# Altium schematic sheet Power_Low_Curr.SchDoc
size A3; Organization: Altium Limited; Address1: L3, 12a Rodborough Rd; Address2: Frenchs Forest; Address3: NSW; Address4: Australia 2086
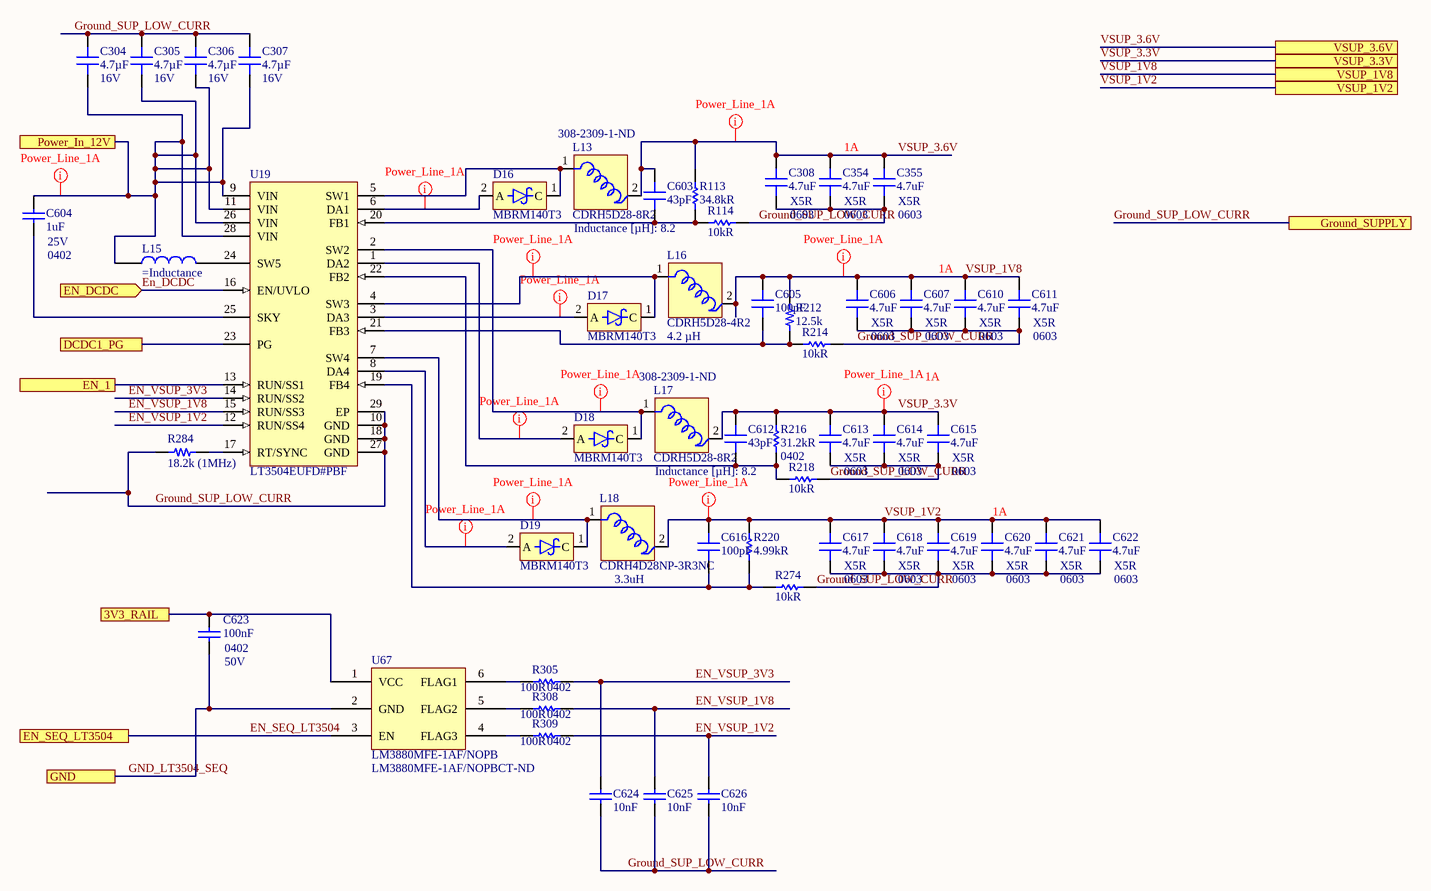
[diagram p0: Power_Low_Curr.SchDoc]

## Parts
C304  4.7µF  Parameter 1: 16V  [CAP 0603/1608 RF]
C305  4.7µF  Parameter 1: 16V  [CAP 0603/1608 RF]
C306  4.7µF  Parameter 1: 16V  [CAP 0603/1608 RF]
C307  4.7µF  Parameter 1: 16V  [CAP 0603/1608 RF]
C308  4.7uF  Case/Package: 0603  Dielectric: X5R  [CAP 0603/1608 RF]
C354  4.7uF  Case/Package: 0603  Dielectric: X5R  [CAP 0603/1608 RF]
C355  4.7uF  Case/Package: 0603  Dielectric: X5R  [CAP 0603/1608 RF]
C603  43pF  [CAP 0201/0603 KK]
C604  1uF  Case/Package: 0402  Voltage Rating: 25V  [CAP 0402/1005 KK]
C605  100pF  [CAP 0201/0603 KK]
C606  4.7uF  Case/Package: 0603  Dielectric: X5R  [CAP 0603/1608 RF]
C607  4.7uF  Case/Package: 0603  Dielectric: X5R  [CAP 0603/1608 RF]
C610  4.7uF  Case/Package: 0603  Dielectric: X5R  [CAP 0603/1608 RF]
C611  4.7uF  Case/Package: 0603  Dielectric: X5R  [CAP 0603/1608 RF]
C612  43pF  [CAP 0201/0603 KK]
C613  4.7uF  Case/Package: 0603  Dielectric: X5R  [CAP 0603/1608 RF]
C614  4.7uF  Case/Package: 0603  Dielectric: X5R  [CAP 0603/1608 RF]
C615  4.7uF  Case/Package: 0603  Dielectric: X5R  [CAP 0603/1608 RF]
C616  100pF  [CAP 0201/0603 KK]
C617  4.7uF  Case/Package: 0603  Dielectric: X5R  [CAP 0603/1608 RF]
C618  4.7uF  Case/Package: 0603  Dielectric: X5R  [CAP 0603/1608 RF]
C619  4.7uF  Case/Package: 0603  Dielectric: X5R  [CAP 0603/1608 RF]
C620  4.7uF  Case/Package: 0603  Dielectric: X5R  [CAP 0603/1608 RF]
C621  4.7uF  Case/Package: 0603  Dielectric: X5R  [CAP 0603/1608 RF]
C622  4.7uF  Case/Package: 0603  Dielectric: X5R  [CAP 0603/1608 RF]
C623  100nF  Case Code (Imperial): 0402  Voltage: 50V  [CAP 0402/1005 KK]
C624  10nF  [CAP 0201/0603 KK]
C625  10nF  [CAP 0201/0603 KK]
C626  10nF  [CAP 0201/0603 KK]
D16  MBRM140T3  [CASE 457]
D17  MBRM140T3  [CASE 457]
D18  MBRM140T3  [CASE 457]
D19  MBRM140T3  [CASE 457]
L13  CDRH5D28-8R2  Inductance [µH]: 8.2  Supplier Part Number 1: 308-2309-1-ND  [CDRH5D28]
L15  (no value)  [FB0603]
L16  CDRH5D28-4R2  Inductance: 4.2 µH  [CDRH5D28]
L17  CDRH5D28-8R2  Inductance [µH]: 8.2  Supplier Part Number 1: 308-2309-1-ND  [CDRH5D28]
L18  CDRH4D28NP-3R3NC  Inductance: 3.3uH  [CDRH4D28NP]
R113  34.8kR  [RES 0402/1005 RF KK]
R114  10kR  [RES 0402/1005 RF KK]
R212  12.5k  [RES 0402/1005 RF KK]
R214  10kR  [RES 0402/1005 RF KK]
R216  31.2kR  Case/Package: 0402  [RES 0402/1005 RF KK]
R218  10kR  [RES 0402/1005 RF KK]
R220  4.99kR  [RES 0402/1005 RF KK]
R274  10kR  [RES 0402/1005 RF KK]
R284  18.2k (1MHz)  [RES 0402/1005 RF KK]
R305  100R  Case/Package: 0402  [RES 0402/1005 RF KK]
R308  100R  Case/Package: 0402  [RES 0402/1005 RF KK]
R309  100R  Case/Package: 0402  [RES 0402/1005 RF KK]
U19  LT3504EUFD#PBF  [LT3504]
U67  LM3880MFE-1AF/NOPB  Supplier Part Number 1: LM3880MFE-1AF/NOPBCT-ND  [LM3880-Q1]

## Ports
3V3_RAIL, DCDC1_PG, EN_1, EN_DCDC (in), EN_SEQ_LT3504, GND, Ground_SUPPLY, Power_In_12V, VSUP_1V2, VSUP_1V8, VSUP_3.3V, VSUP_3.6V

## Nets
3V3_RAIL: C623.2 U67.1(VCC) ; port 3V3_RAIL
DCDC1_PG: U19.23(PG) ; port DCDC1_PG
EN_1: U19.13(RUN/SS1) ; port EN_1
En_DCDC: U19.16(EN/UVLO) ; port EN_DCDC
EN_SEQ_LT3504: U67.3(EN) ; port EN_SEQ_LT3504
EN_VSUP_1V2: C626.2 R309.2 U19.12(RUN/SS4)
EN_VSUP_1V8: C625.2 R308.1 U19.15(RUN/SS3)
EN_VSUP_3V3: C624.2 R305.2 U19.14(RUN/SS2)
GND_LT3504_SEQ: C623.1 U67.2(GND) ; port GND
Ground_SUP_LOW_CURR: C304.2 C305.2 C306.2 C307.2 C308.1 C354.1 C355.1 C606.1 C607.1 C610.1 C611.1 C613.1 C614.1 C615.1 C617.1 C618.1 C619.1 C620.1 C621.1 C622.1 C624.1 C625.1 C626.1 R114.1 R214.1 R218.1 R274.1 R284.1 U19.10(GND) U19.18(GND) U19.27(GND) U19.29(EP) ; port Ground_SUPPLY
Power_In_12V: C304.1 C305.1 C306.1 C307.1 C604.2 L15.1 U19.9(VIN) U19.11(VIN) U19.26(VIN) U19.28(VIN) ; port Power_In_12V
VSUP_1V2: C616.2 C617.2 C618.2 C619.2 C620.2 C621.2 C622.2 L18.2 R220.2 ; port VSUP_1V2
VSUP_1V8: C605.2 C606.2 C607.2 C610.2 C611.2 L16.2 R212.2 ; port VSUP_1V8
VSUP_3.3V: C612.2 C613.2 C614.2 C615.2 L17.2 R216.1 ; port VSUP_3.3V
VSUP_3.6V: C308.2 C354.2 C355.2 C603.2 L13.2 R113.2 ; port VSUP_3.6V
NetC603_1: C603.1 R113.1 R114.2 U19.20(FB1)
NetC604_1: C604.1 U19.25(SKY)
NetC605_1: C605.1 R212.1 R214.2 U19.21(FB3)
NetC612_1: C612.1 R216.2 R218.2 U19.22(FB2)
NetC616_1: C616.1 R220.1 R274.2 U19.19(FB4)
NetD16_1: D16.1(C) L13.1 U19.5(SW1)
NetD16_2: D16.2(A) U19.6(DA1)
NetD17_1: D17.1(C) L16.1 U19.4(SW3)
NetD17_2: D17.2(A) U19.3(DA3)
NetD18_1: D18.1(C) L17.1 U19.2(SW2)
NetD18_2: D18.2(A) U19.1(DA2)
NetD19_1: D19.1(C) L18.1 U19.7(SW4)
NetD19_2: D19.2(A) U19.8(DA4)
NetL15_2: L15.2 U19.24(SW5)
NetR284_2: R284.2 U19.17(RT/SYNC)
NetR305_1: R305.1 U67.6(FLAG1)
NetR308_2: R308.2 U67.5(FLAG2)
NetR309_1: R309.1 U67.4(FLAG3)

## Layout directives
net class Power_Line_1A: NetD16_2, NetD17_1, NetD17_2, NetD18_1, NetD18_2, NetD19_1, NetD19_2, Power_In_12V, VSUP_1V2, VSUP_1V8, VSUP_3.3V, VSUP_3.6V

## Notes on the sheet
- 1A
- (near C620) 1A
- Title
- Size:
- Date:
- A3
- Number:
- Time:
- Revision:
- Sheet
- of
- File:

## Library data of the parts
C304-C307 = Capacitor: SMT Capacitor; Part Number: CL10A475KO8NNNC; Value: 4.7µF; Supplier 1: Digi-Key; Supplier Part Number 1: 1276-1784-2-ND
C308 C354 C355 C606 C607 C610 C611 C613-C615 C617-C622 = Capacitor: Manufacturer: Samsung; Manufacturer Part Number: CL10A475KP8NNNC; Tolerance: 10%; Voltage Rating: 10V; Supplier 1: Digi-Key; Supplier Part Number 1: 1276-1044-1-ND; Stock 1: 2124648; Pricing 1: 1 = 0,13000, 10 = 0,09600, 100 = 0,04520, 500 = 0,03168, 1000 = 0,02622 (USD); RoHS: Yes; Mount: Surface Mount; Case Code (Metric): 1608; Case Code (Imperial): 0603; Contact Plating: Tin; Min Operating Temperature: -55°C; Max Operating Temperature: 85°C; Capacitance: 4.7uF; Package Quantity: 1; Packaging: Tape and Reel; Length: 1.6mm; Height: 0.8mm; Width: 0.031inch; Thickness: 0.035inch; Depth: 0.8mm; Radiation Hardening: No; ComponentLink1URL: https://datasheet.ciiva.com/25797/cl10a475kp8nnnc-25797520.pdf?src-supplier=Digi-Key; ComponentLink1Description: https://datasheet.ciiva.com/25797/cl10a475kp8nnnc-25797520.pdf?src-supplier=Digi-Key; ComponentLink2URL: https://datasheet.ciiva.com/26838/getdatasheetpartid-358676-26838384.pdf?src-supplier=Verical; ComponentLink2Description: https://datasheet.ciiva.com/26838/getdatasheetpartid-358676-26838384.pdf?src-supplier=Verical; ComponentLink3URL: https://datasheet.ciiva.com/16318/cl05b104kq5nnnc-16318245.pdf?src-supplier=Future+Electronics; ComponentLink3Description: https://datasheet.ciiva.com/16318/cl05b104kq5nnnc-16318245.pdf?src-supplier=Future+Electronics
C603 C612 = Capacitor: Manufacturer: Murata; Manufacturer Part Number: GRM0335C1H430GA01D; Tolerance: 2%; Voltage Rating: 50V; Dielectric: C0G; Supplier 1: Digi-Key; Supplier Part Number 1: 490-14799-1-ND; Stock 1: 52010; Pricing 1: 1 = 0,10000, 10 = 0,01800, 100 = 0,00810, 500 = 0,00578, 1000 = 0,00454, 2500 = 0,00412, 5000 = 0,00380 (USD); RoHS: Yes; Mount: Surface Mount; Case/Package: 0201; Case Code (Metric): 0603; Case Code (Imperial): 0201; Min Operating Temperature: -55°C; Max Operating Temperature: 125°C; Packaging: Tape and Reel; Package Quantity: 15000; Capacitance: 43pF; Termination: SMD/SMT; Voltage Rating (DC): 50V; Length: 0.024inch; Width: 0.012inch; Thickness: 0.012inch; Depth: 0.3mm; Lead Free: Lead Free; ComponentLink1URL: http://components.arrow.com/part/dataview/0323_07279725?src-supplier=Arrow+Europe; ComponentLink1Description: http://components.arrow.com/part/dataview/0323_07279725?src-supplier=Arrow+Europe; ComponentLink2URL: http://www.mouser.com/ds/2/281/c02e-2905.pdf?src-supplier=Mouser; ComponentLink2Description: http://www.mouser.com/ds/2/281/c02e-2905.pdf?src-supplier=Mouser; ComponentLink3URL: http://components.arrow.com/part/dataview/55790600S306921N2606?src-supplier=Arrow; ComponentLink3Description: http://components.arrow.com/part/dataview/55790600S306921N2606?src-supplier=Arrow; ComponentLink4URL: https://search.murata.co.jp/Ceramy/image/img/A01X/G101/ENG/GRM0335C1H430GA01-01.pdf?src-supplier=Digi-Key; ComponentLink4Description: https://search.murata.co.jp/Ceramy/image/img/A01X/G101/ENG/GRM0335C1H430GA01-01.pdf?src-supplier=Digi-Key; ComponentLink5URL: http://search.murata.co.jp/Ceramy/image/img/A01X/partnumbering_e_01.pdf?src-supplier=Digi-Key; ComponentLink5Description: http://search.murata.co.jp/Ceramy/image/img/A01X/partnumbering_e_01.pdf?src-supplier=Digi-Key; ComponentLink6URL: http://psearch.en.murata.com/capacitor/product/GRM0335C1H430GA01%23.pdf?src-supplier=Avnet; ComponentLink6Description: http://psearch.en.murata.com/capacitor/product/GRM0335C1H430GA01%23.pdf?src-supplier=Avnet
C604 = Capacitor: MURATA - GRT155R61E105KE01D - SMD Multilayer Ceramic Capacitor, 1 µF, 25 V, 0402 [1005 Metric], ± 10%, X5R, GRT Series - SMD Multilayer Ceramic Capacitor, 1 µF, 25 V, 0402 [1005 Metric], ± 10%, X5R, GRT Series; Supplier 1: Digi-Key; Supplier Part Number 1: 490-12263-1-ND; Manufacturer: Murata; Manufacturer Part Number: GRT155R61E105KE01D; RoHS: Yes; Category: Ceramic Capacitors; Stock 1: 341453; Pricing 1: 1=0,18000, 10=0,12300, 100=0,06210, 500=0,04248, 1000=0,03758, 2500=0,03594, 5000=0,03268 (USD); Mount: Surface Mount; Case Code (Metric): 1005; Case Code (Imperial): 0402; Min Operating Temperature: -55°C; Max Operating Temperature: 85°C; Packaging: Tape and Reel; Capacitance: 1uF; Tolerance: 10%; Dielectric: X5R; Voltage Rating (DC): 25V; Length: 0.039inch; Width: 0.02inch; Thickness: 0.022inch; Ratings: AEC-Q200; ComponentLink1URL: http://www.farnell.com/datasheets/2165918.pdf?src-supplier=Farnell; ComponentLink1Description: http://www.farnell.com/datasheets/2165918.pdf?src-supplier=Farnell; ComponentLink2URL: http://search.murata.co.jp/Ceramy/image/img/A01X/G101/ENG/GRT155R61E105KE01-01.pdf?src-supplier=Digi-Key; ComponentLink2Description: http://search.murata.co.jp/Ceramy/image/img/A01X/G101/ENG/GRT155R61E105KE01-01.pdf?src-supplier=Digi-Key; ComponentLink3URL: http://www.farnell.com/datasheets/2165918.pdf?src-supplier=Element14; ComponentLink3Description: http://www.farnell.com/datasheets/2165918.pdf?src-supplier=Element14
C605 C616 = Capacitor: Manufacturer: Murata; Manufacturer Part Number: GRM0335C1E101JA01D; Tolerance: 5%; Voltage Rating: 25V; Dielectric: C0G; Supplier 1: Digi-Key; Supplier Part Number 1: 490-3160-1-ND; Stock 1: 1884783; Pricing 1: 1 = 0,10000, 10 = 0,01300, 100 = 0,00560, 500 = 0,00400, 1000 = 0,00315, 2500 = 0,00286, 5000 = 0,00263 (USD); RoHS: Yes; Mount: Surface Mount; Case/Package: 0201; Case Code (Metric): 0603; Case Code (Imperial): 0201; Min Operating Temperature: -55°C; Max Operating Temperature: 125°C; Package Quantity: 15000; Packaging: Tape and Reel; Capacitance: 100pF; Voltage Rating (DC): 25V; Termination: SMD/SMT; Voltage: 25V; Length: 0.6mm; Height: 0.3mm; Width: 0.012inch; Thickness: 0.013inch; Depth: 0.3mm; Radiation Hardening: No; REACH SVHC: No SVHC; Lead Free: Lead Free; ComponentLink1URL: https://datasheet.ciiva.com/16497/grm0335c1e101ja01-01-16497112.pdf?src-supplier=Future+Electronics; ComponentLink1Description: https://datasheet.ciiva.com/16497/grm0335c1e101ja01-01-16497112.pdf?src-supplier=Future+Electronics; ComponentLink2URL: https://datasheet.ciiva.com/18697/product-18697797.pdf?src-supplier=Digi-Key; ComponentLink2Description: https://datasheet.ciiva.com/18697/product-18697797.pdf?src-supplier=Digi-Key
C623 = Capacitor: CAP CER 0.1UF 50V X5R 0402; Manufacturer: Murata; Manufacturer Part Number: GRM155R61H104KE14D; Dielectric Material: Ceramic; Dissipation Factor: 0.025%; Tolerance: 10%; Supplier 1: Digi-Key; Supplier Part Number 1: 490-10697-1-ND; RoHS: Yes; Category: Ceramic Capacitors; Stock 1: 435607; Pricing 1: 1=0,10000, 10=0,04600, 100=0,02050, 500=0,01464, 1000=0,01150, 2500=0,01045, 5000=0,00961 (USD); Mount: Surface Mount; Case/Package: 0402; Weight: 0.000212oz; Case Code (Metric): 1005; Min Operating Temperature: -55°C; Max Operating Temperature: 85°C; Capacitance: 100nF; Packaging: Tape and Reel; Voltage Rating: 50V; Dielectric: X5R; Termination: SMD/SMT; Composition: Ceramic; Voltage Rating (DC): 50V; Package Quantity: 10000; Length: 1mm; Height: 0.5mm; Width: 0.02inch; Thickness: 0.022inch; Depth: 0.5mm; REACH SVHC: No SVHC; Lead Free: Lead Free; ComponentLink1URL: http://www.farnell.com/datasheets/2079150.pdf?src-supplier=Farnell; ComponentLink1Description: http://www.farnell.com/datasheets/2079150.pdf?src-supplier=Farnell; ComponentLink2URL: http://www.mouser.com/ds/2/281/c02e-2905.pdf?src-supplier=Mouser; ComponentLink2Description: http://www.mouser.com/ds/2/281/c02e-2905.pdf?src-supplier=Mouser; ComponentLink3URL: http://www.farnell.com/datasheets/2079150.pdf?src-supplier=Element14; ComponentLink3Description: http://www.farnell.com/datasheets/2079150.pdf?src-supplier=Element14; ComponentLink4URL: http://search.murata.co.jp/Ceramy/image/img/A01X/G101/ENG/GRM155R61H104KE14-01.pdf?src-supplier=Digi-Key; ComponentLink4Description: http://search.murata.co.jp/Ceramy/image/img/A01X/G101/ENG/GRM155R61H104KE14-01.pdf?src-supplier=Digi-Key
C624-C626 = Capacitor: CAP CER 10000PF 16V X7R 0201; Manufacturer: Murata; Manufacturer Part Number: GRM033R71C103KE14D; Tolerance: 10%; Supplier 1: Digi-Key; Supplier Part Number 1: 490-14453-1-ND; RoHS: No; Category: Ceramic Capacitors; Stock 1: 188777; Pricing 1: 1=0,10000, 10=0,01900, 100=0,00870, 500=0,00620, 1000=0,00487, 2500=0,00443, 5000=0,00407 (USD); Voltage Rating (DC): 16V; Dielectric: X7R; Capacitance: 10nF; Length: 600um; Width: 300um; Thickness: 300um; ComponentLink1URL: http://www.farnell.com/datasheets/2722745.pdf?src-supplier=Farnell; ComponentLink1Description: http://www.farnell.com/datasheets/2722745.pdf?src-supplier=Farnell; ComponentLink2URL: http://www.farnell.com/datasheets/2722745.pdf?src-supplier=Newark; ComponentLink2Description: http://www.farnell.com/datasheets/2722745.pdf?src-supplier=Newark; ComponentLink3URL: http://www.farnell.com/datasheets/2722745.pdf?src-supplier=Element14; ComponentLink3Description: http://www.farnell.com/datasheets/2722745.pdf?src-supplier=Element14; ComponentLink4URL: http://search.murata.co.jp/Ceramy/image/img/A01X/G101/ENG/GRM033R71C103KE14-01.pdf?src-supplier=Digi-Key; ComponentLink4Description: http://search.murata.co.jp/Ceramy/image/img/A01X/G101/ENG/GRM033R71C103KE14-01.pdf?src-supplier=Digi-Key
D16-D19 = MBRM140T1G: Supplier Part Number 1: MBRM140T3GOSCT-ND; Supplier 1: Digi-Key
L13 L17 = CDRH5D28-8R2: Part Number: CDRH5D28NP-8R2; Supplier 2: Digi-Key
  L17: Supplier Part Number 2: 308-2309-6-ND; Supplier 1: Digi-Key
L15 = Inductor: Manufacturer: TDK; Manufacturer Part Number: MLZ1608N6R8LT000; Supplier 1: Digi-Key; Supplier Part Number 1: 445-MLZ1608N6R8LT000CT-ND; Stock 1: 3883; Pricing 1: 1 = 0,17000, 10 = 0,15500, 100 = 0,10350, 500 = 0,08626, 1000 = 0,07245 (USD)
L18 = CDRH4D28NP-3R3NC: Fixed Inductors 3.3uH 1.57A 30% SMD LP INDUCTOR; Manufacturer: Sumida; Core Material: Ferrite; Shielding: Shielded; DC Resistance (DCR): 49.2mR; Test Frequency: 100kHz; Supplier 1: Digi-Key; Manufacturer Part Number: CDRH4D28NP-3R3NC; Stock 1: 33311; Pricing 1: 1 = 0,93000, 10 = 0,86000, 100 = 0,62160, 500 = 0,47610, 1000 = 0,42320 (USD); RoHS: Yes; Mount: Surface Mount; Case/Package: Nonstandard; Weight: 0.007055oz; Min Operating Temperature: -40°C; Max Operating Temperature: 100°C; Package Quantity: 2000; Current Rating: 1.57A; Tolerance: 30%; Packaging: Tape and Reel; Max DC Current: 1.57A; Termination: SMD/SMT; Length: 0.185inch; Height: 3mm; Width: 0.197inch; Height - Seated (Max): 0.118inch; Depth: 5mm; Radiation Hardening: No; Lead Free: Lead Free; ComponentLink1URL: http://www.mouser.com/ds/2/390/CDRH4D28-515415.pdf?src-supplier=Mouser; ComponentLink1Description: http://www.mouser.com/ds/2/390/CDRH4D28-515415.pdf?src-supplier=Mouser; ComponentLink2URL: http://www.sumida.com/products/pdf/CDRH4D28,CDRH4D28C,CDRH4D28CLD.pdf?src-supplier=Digi-Key; ComponentLink2Description: http://www.sumida.com/products/pdf/CDRH4D28,CDRH4D28C,CDRH4D28CLD.pdf?src-supplier=Digi-Key; ComponentLink3URL: http://www.sumida.com/products/pdf/CDRH4D28.pdf?src-supplier=Future+Electronics; ComponentLink3Description: http://www.sumida.com/products/pdf/CDRH4D28.pdf?src-supplier=Future+Electronics; ComponentLink4URL: http://products.sumida.com/products/pdf/CDRH4D28.pdf?src-supplier=Digi-Key; ComponentLink4Description: http://products.sumida.com/products/pdf/CDRH4D28.pdf?src-supplier=Digi-Key; ComponentLink5URL: http://www.sumida.com/products/pdf/CDRH4D28.pdf?src-supplier=Avnet; ComponentLink5Description: http://www.sumida.com/products/pdf/CDRH4D28.pdf?src-supplier=Avnet; Supplier Part Number 1: 308-2184-1-ND
R113 = Resistor: Thick Film Resistors 34.8K OHM 1%; Manufacturer: Yageo; Manufacturer Part Number: RC0402FR-0734K8L; Power Rating: 62.5mW; Voltage Rating: 50V; Temperature Coefficient: 100ppm/°C; Max Power Dissipation: 63mW; Supplier 1: Digi-Key; Supplier Part Number 1: YAG3125CT-ND; RoHS: Yes; Category: Chip SMD Resistors; Stock 1: 121134; Pricing 1: 1=0,10000, 10=0,01600, 100=0,00640, 1000=0,00289, 2500=0,00251, 5000=0,00207 (USD); Case/Package: 0402; Case Code (Imperial): 0402; Case Code (Metric): 1005; Contact Plating: Tin,Matte; Min Operating Temperature: -55°C; Max Operating Temperature: 155°C; Resistance: 34.8kR; Tolerance: 1%; Packaging: Tape and Reel; Composition: Thick Film; Number of Terminations: 2; Termination: SMD/SMT; Military Standard: Not; Voltage Rating (DC): 50V; Features: Moisture Resistant; Length: 1mm; Height: 0.016inch; Width: 0.02inch; Depth: 0.5mm; Lead Free: Lead Free; ComponentLink1URL: https://datasheet.ciiva.com/16857/pyu-rc0402-51-rohs-l-6-16857399.pdf?src-supplier=Avnet+Europe; ComponentLink1Description: https://datasheet.ciiva.com/16857/pyu-rc0402-51-rohs-l-6-16857399.pdf?src-supplier=Avnet+Europe; ComponentLink2URL: https://datasheet.ciiva.com/26830/getdatasheetpartid-323739-26830055.pdf?src-supplier=Verical; ComponentLink2Description: https://datasheet.ciiva.com/26830/getdatasheetpartid-323739-26830055.pdf?src-supplier=Verical; ComponentLink3URL: https://datasheet.ciiva.com/12656/pyu-rc0402-51-rohs-l-6-r-12656904.pdf?src-supplier=Mouser; ComponentLink3Description: https://datasheet.ciiva.com/12656/pyu-rc0402-51-rohs-l-6-r-12656904.pdf?src-supplier=Mouser; ComponentLink4URL: https://datasheet.ciiva.com/28400/pyu-rc0402-51-rohs-l-6-28400889.pdf?src-supplier=Avnet+Europe; ComponentLink4Description: https://datasheet.ciiva.com/28400/pyu-rc0402-51-rohs-l-6-28400889.pdf?src-supplier=Avnet+Europe; ComponentLink5URL: https://datasheet.ciiva.com/8889/pyu-rc0402-51-rohs-l-6-8889501.pdf?src-supplier=Avnet; ComponentLink5Description: https://datasheet.ciiva.com/8889/pyu-rc0402-51-rohs-l-6-8889501.pdf?src-supplier=Avnet
R114 R214 R218 R274 = Resistor: Manufacturer 1: Yageo; Manufacturer Part Number 1: RC0402FR-0710KL; Tolerance: 1%; Temperature Coefficient: 100ppm/°C; Voltage Rating: 50V; Power Rating: 62.5mW; Supplier 1: Digi-Key; Supplier Part Number 1: 311-10.0KLRCT-ND; Stock 1: 71214322; Pricing 1: 1=0,10000, 10=0,01500, 100=0,00600, 1000=0,00270, 2500=0,00235, 5000=0,00194 (USD); RoHS: Yes; Case/Package: 0402; Number of Pins: 2; Case Code (Imperial): 0402; Case Code (Metric): 1005; Min Operating Temperature: -55°C; Max Operating Temperature: 155°C; Resistance: 10kR; Packaging: Tape and Reel; Composition: Thick Film; Voltage Rating (DC): 50V; Termination: SMD/SMT; Military Standard: Not; Working Voltage: 50V; Number of Terminations: 2; Length: 1mm; Height: 0.32mm; Width: 0.5mm; Depth: 0.5mm; Lead Pitch: 0.2mm; REACH SVHC: No SVHC; Lead Free: Lead Free; ComponentLink1URL: https://datasheet.ciiva.com/7660/38568-7660787.pdf?src-supplier=Element14; ComponentLink1Description: https://datasheet.ciiva.com/7660/38568-7660787.pdf?src-supplier=Element14; ComponentLink2URL: https://datasheet.ciiva.com/7849/1784430-7849813.pdf?src-supplier=Element14; ComponentLink2Description: https://datasheet.ciiva.com/7849/1784430-7849813.pdf?src-supplier=Element14; ComponentLink3URL: https://datasheet.ciiva.com/7849/1686128-7849814.pdf?src-supplier=Element14; ComponentLink3Description: https://datasheet.ciiva.com/7849/1686128-7849814.pdf?src-supplier=Element14; ComponentLink4URL: https://datasheet.ciiva.com/7849/1784430-7849815.pdf?src-supplier=Element14; ComponentLink4Description: https://datasheet.ciiva.com/7849/1784430-7849815.pdf?src-supplier=Element14; ComponentLink5URL: https://datasheet.ciiva.com/22747/1018594-22747512.pdf?src-supplier=Element14; ComponentLink5Description: https://datasheet.ciiva.com/22747/1018594-22747512.pdf?src-supplier=Element14; ComponentLink6URL: https://datasheet.ciiva.com/12667/pyu-rc0402-51-rohs-l-6-r-12667067.pdf?src-supplier=Mouser; ComponentLink6Description: https://datasheet.ciiva.com/12667/pyu-rc0402-51-rohs-l-6-r-12667067.pdf?src-supplier=Mouser; ComponentLink7URL: https://datasheet.ciiva.com/7983/1018594-7983486.pdf?src-supplier=Element14; ComponentLink7Description: https://datasheet.ciiva.com/7983/1018594-7983486.pdf?src-supplier=Element14
R212 R284 = Resistor: SMT Resistor; Part Number: *; Supplier 1: Digi-Key
  R212: Value: 12.5k; Supplier Part Number 1: RR05P12.4KDCT-ND
  R284: Value: 18.2k (1MHz); Supplier Part Number 1: RR05P18.2KDCT-ND
R216 = Resistor: Manufacturer: Vishay Dale; Manufacturer Part Number: TNPW040231K2BEED; Tolerance: 0.1%; Max Power Dissipation: 63mW; Temperature Coefficient: 25ppm/°C; Supplier 1: Digi-Key; Supplier Part Number 1: 541-3564-1-ND; Stock 1: 4196; Pricing 1: 1 = 0,62000, 10 = 0,44000, 100 = 0,22880, 1000 = 0,12320, 2500 = 0,11968 (USD); RoHS: Yes; Contact Plating: Tin; Min Operating Temperature: -55°C; Max Operating Temperature: 125°C; Packaging: Tape and Reel; Resistance: 31.2kR; Composition: Thin Film; Number of Terminations: 2; Features: Moisture Resistant,Automotive AEC-Q200,Anti-Sulfur; Length: 0.039inch; Height: 0.016inch; Width: 0.02inch; Radiation Hardening: No; ComponentLink1URL: https://datasheet.ciiva.com/9018/tnpw-e3-9018042.pdf?src-supplier=Avnet; ComponentLink1Description: https://datasheet.ciiva.com/9018/tnpw-e3-9018042.pdf?src-supplier=Avnet
R220 = Resistor: Manufacturer: Panasonic; Manufacturer Part Number: ERA-2AEB4991X; Power Rating: 62.5mW; Tolerance: 0.1%; Temperature Coefficient: 25ppm/°C; Voltage Rating: 50V; Max Power Dissipation: 63mW; Supplier 1: Digi-Key; Supplier Part Number 1: P4.99KDCCT-ND; Stock 1: 146974; Pricing 1: 1 = 0,45000, 10 = 0,32100, 100 = 0,12830, 1000 = 0,06322, 2500 = 0,05858, 5000 = 0,05300 (USD); RoHS: Yes; Mount: Surface Mount; Case/Package: 0402; Case Code (Metric): 1005; Case Code (Imperial): 0402; Min Operating Temperature: -55°C; Max Operating Temperature: 155°C; Resistance: 4.99kR; Packaging: Tape and Reel; Package Quantity: 1; Composition: Thin Film; Number of Terminations: 2; Voltage Rating (DC): 50V; Features: Automotive AEC-Q200; Length: 0.039inch; Height: 0.016inch; Width: 0.02inch; REACH SVHC: Unknown; Lead Free: Lead Free; ComponentLink1URL: https://datasheet.ciiva.com/30094/54aoa0000ce26-30094171.pdf?src-supplier=Onlinecomponents.com; ComponentLink1Description: https://datasheet.ciiva.com/30094/54aoa0000ce26-30094171.pdf?src-supplier=Onlinecomponents.com
R305 R308 R309 = Resistor: RES SMD 100 OHM 1% 1/16W 0402; Manufacturer: Yageo; Manufacturer Part Number: RC0402FR-07100RL; Power Rating: 62.5mW; Voltage Rating: 50V; Temperature Coefficient: 100ppm/°C; Supplier 1: Digi-Key; Supplier Part Number 1: 311-100LRDKR-ND; RoHS: Yes; Category: Chip SMD Resistors; Stock 1: 42078262; Pricing 1: 1=0,10000, 10=0,01600, 100=0,00640, 1000=0,00289, 2500=0,00251, 5000=0,00207 (USD); Number of Pins: 2; Case Code (Imperial): 0402; Case Code (Metric): 1005; Min Operating Temperature: -55°C; Max Operating Temperature: 155°C; Tolerance: 1%; Resistance: 100R; Packaging: Tape and Reel; Termination: SMD/SMT; Composition: Thick Film; Military Standard: Not; Voltage Rating (DC): 50V; Length: 1mm; Height: 0.32mm; Depth: 0.5mm; Width: 0.5mm; REACH SVHC: No SVHC; Lead Free: Lead Free; ComponentLink1URL: https://datasheet.ciiva.com/7849/1784430-7849810.pdf?src-supplier=Element14; ComponentLink1Description: https://datasheet.ciiva.com/7849/1784430-7849810.pdf?src-supplier=Element14; ComponentLink2URL: https://datasheet.ciiva.com/11808/0900766b80c66297-11808765.pdf?src-supplier=RSComponents; ComponentLink2Description: https://datasheet.ciiva.com/11808/0900766b80c66297-11808765.pdf?src-supplier=RSComponents; ComponentLink3URL: https://datasheet.ciiva.com/12667/pyu-rc0402-51-rohs-l-6-r-12667957.pdf?src-supplier=Mouser; ComponentLink3Description: https://datasheet.ciiva.com/12667/pyu-rc0402-51-rohs-l-6-r-12667957.pdf?src-supplier=Mouser; ComponentLink4URL: https://datasheet.ciiva.com/16740/pyu-rc0402-51-rohs-l-6-r-16740566.pdf?src-supplier=Future+Electronics; ComponentLink4Description: https://datasheet.ciiva.com/16740/pyu-rc0402-51-rohs-l-6-r-16740566.pdf?src-supplier=Future+Electronics; ComponentLink5URL: https://datasheet.ciiva.com/15189/getdatasheetpartid-329466-15189335.pdf?src-supplier=Verical; ComponentLink5Description: https://datasheet.ciiva.com/15189/getdatasheetpartid-329466-15189335.pdf?src-supplier=Verical; ComponentLink6URL: https://datasheet.ciiva.com/28367/1018594-28367226.pdf?src-supplier=Element14; ComponentLink6Description: https://datasheet.ciiva.com/28367/1018594-28367226.pdf?src-supplier=Element14; ComponentLink7URL: https://datasheet.ciiva.com/22747/1018594-22747511.pdf?src-supplier=Element14; ComponentLink7Description: https://datasheet.ciiva.com/22747/1018594-22747511.pdf?src-supplier=Element14
U19 = LT3504EUFD#PBF: Quad 40 V / 1 A Step-Down Switching Regulator with 100% Duty Cycle Operation, 28-pin QFN (UFD-28), -40 to 125 degC, Pb-Free; Manufacturer: Linear Technology; Number of Outputs: 4; PackageVersion: Rev. B, 06/2010; PackageReference: UFD-28; PackageDescription: 28-Pin Plastic QFN, Body 5 x 4 mm, Pitch 0.5 mm; Supplier 1: Digi-Key; Supplier Part Number 1: LT3504EUFD#PBF-ND; Supplier 2: Farnell; Supplier Part Number 2: 2215129; Supplier 3: Newark; Supplier Part Number 3: 27W9523; RoHS: TRUE; Mounting Technology: Surface Mount; Code_JEDEC: MO-220; PartNumber: LT3504EUFD#PBF; ComponentLink1Description: Manufacturer URL; ComponentLink1URL: http://www.linear.com/; ComponentLink2Description: Datasheet; ComponentLink2URL: http://cds.linear.com/docs/en/datasheet/3504fa.pdf; ComponentLink3Description: Package Specification; ComponentLink3URL: http://cds.linear.com/docs/en/packaging/QFN_28_05-08-1712.pdf
U67 = LM3880MFE-1AF/NOPB: IC PWR SUPPLY SEQUENCER SOT23-6; Manufacturer: TI National Semiconductor; Min Supply Voltage: 2.7V; Max Supply Voltage: 5.5V; Operating Supply Current: 25uA; Number of Voltages Monitored: 3; Overvoltage Threshold: 1.4V; Undervoltage Threshold: 1V; Watchdog Timer: No; Supplier 1: Digi-Key; Manufacturer Part Number: LM3880MFE-1AF/NOPB; Stock 1: 1640; Pricing 1: 1 = 1,55000, 10 = 1,38600, 25 = 1,31520, 100 = 1,00980 (USD); RoHS: Yes; Mount: Surface Mount; Case/Package: SOT-23-6; Number of Pins: 6; Min Operating Temperature: -40°C; Max Operating Temperature: 125°C; Packaging: Tape and Reel; Package Quantity: 250; Quiescent Current: 25uA; Lead Free: Lead Free; ComponentLink1URL: https://datasheet.ciiva.com/14811/snvs451i-14811203.pdf?src-supplier=Arrow; ComponentLink1Description: https://datasheet.ciiva.com/14811/snvs451i-14811203.pdf?src-supplier=Arrow; ComponentLink2URL: https://datasheet.ciiva.com/15105/getdatasheetpartid-633699-15105702.pdf?src-supplier=Verical; ComponentLink2Description: https://datasheet.ciiva.com/15105/getdatasheetpartid-633699-15105702.pdf?src-supplier=Verical; ComponentLink3URL: https://datasheet.ciiva.com/3231/lm3880-3231307.pdf?src-supplier=Avnet; ComponentLink3Description: https://datasheet.ciiva.com/3231/lm3880-3231307.pdf?src-supplier=Avnet; ComponentLink4URL: https://datasheet.ciiva.com/6598/lm3880-6598591.pdf?src-supplier=Digi-Key; ComponentLink4Description: https://datasheet.ciiva.com/6598/lm3880-6598591.pdf?src-supplier=Digi-Key
L16 = CDRH5D28-4R2: Supplier 1: Digi-Key; Supplier Part Number 1: 308-1802-1-ND